# Altium schematic sheet 3.MCU NRF52840.SchDoc: Thingy:91 nRF52840 MCU
size A3; Organization: Nordic Semiconductor; DocumentNumber: 3; SheetNumber: 3; SheetTotal: 6; CompanyName: Nordic Semiconductor; DocumentSize: A3
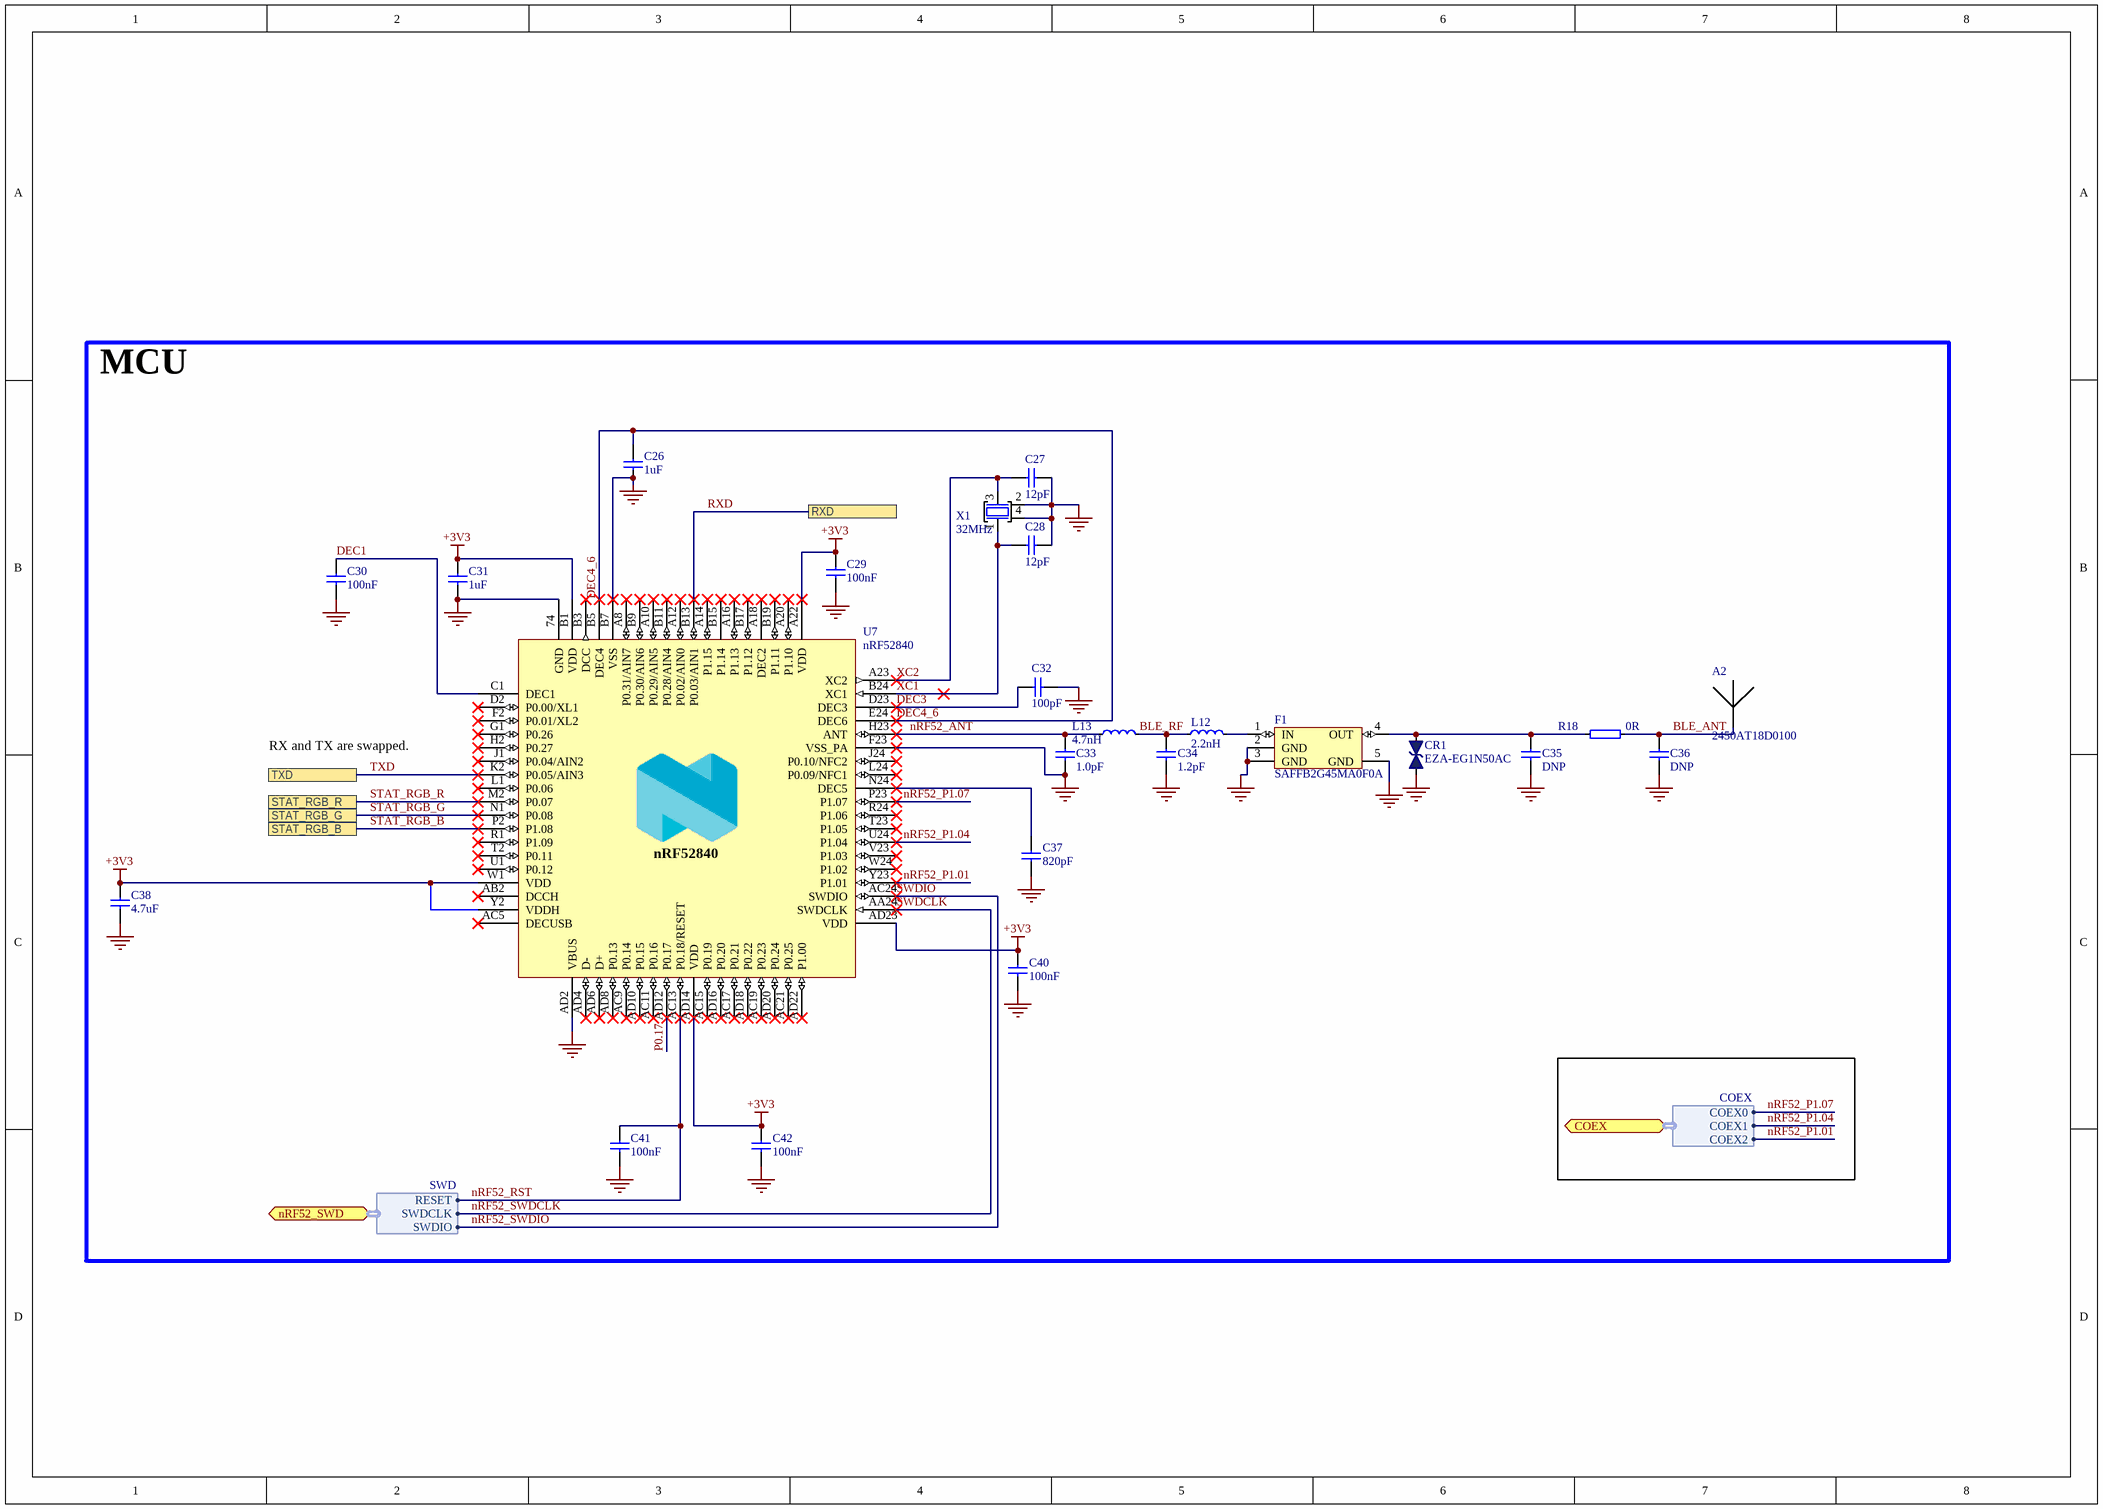
[diagram p0: 3.MCU NRF52840.SchDoc]

## Parts
A2  2450AT18D0100  [2450AT18D0100_STD-R]
C26  1uF  [CAPC1005X04L]
C27  12pF  [CAPC1005X04L]
C28  12pF  [CAPC1005X04L]
C29  100nF  [CAPC1005X04L]
C30  100nF  [CAPC1005X04L]
C31  1uF  [CAPC1005X04L]
C32  100pF  [CAPC1005X04L]
C33  1.0pF  [CAPC0603X03L_C]
C34  1.2pF  [CAPC0603X03L_C]
C35  DNP  [CAPC0603X03L_C]
C36  DNP  [CAPC0603X03L_C]
C37  820pF  [CAPC1005X04L]
C38  4.7uF  [CAPC1005X04L]
C40  100nF  [CAPC1005X04L]
C41  100nF  [CAPC1005X04L]
C42  100nF  [CAPC1005X04L]
CR1  EZA-EG1N50AC  [RESC0603X03L_C]
F1  SAFFB2G45MA0F0A  [SAFFB2G45MA0F0A]
L12  2.2nH  [INDC0603X03L_C]
L13  4.7nH  [INDC0603X03L_C]
R18  0R  [RESC0603X03L_C]
U7  nRF52840  [AQFN50P700X700X85_HS-74N]
X1  32MHz  [BT-XTAL_2016]

## Ports
COEX (bidir, harness COEX), nRF52_SWD (bidir, harness SWD), RXD, STAT_RGB_B, STAT_RGB_G, STAT_RGB_R, TXD

## Harnesses
COEX: COEX2, COEX1, COEX0
SWD: SWDIO, SWDCLK, RESET

## Nets
+3V3: C29.1 C31.1 C38.1 C40.1 C42.1 U7.A22(VDD) U7.AD14(VDD) U7.AD23(VDD) U7.B1(VDD) U7.W1(VDD) U7.Y2(VDDH)
GND: A2.2(GND) C26.2 C27.2 C28.2 C29.2 C30.2 C31.2 C32.2 C33.1 C34.1 C35.1 C36.1 C37.2 C38.2 C40.2 C41.2 C42.2 CR1.1 F1.2(GND) F1.3(GND) F1.5(GND) U7.74(GND) U7.AD2(VBUS) U7.B7(VSS) U7.F23(VSS_PA) X1.2(GND) X1.4(GND)
BLE_ANT: A2.1 C36.2 R18.2
BLE_RF: C34.2 L12.1 L13.2
DEC1: C30.1 U7.C1(DEC1)
DEC3: C32.1 U7.D23(DEC3)
DEC4_6: C26.1 U7.B5(DEC4) U7.E24(DEC6)
nRF52_ANT: C33.2 L13.1 U7.H23(ANT)
nRF52_P1.01: U7.Y23(P1.01) ; port COEX.COEX2
nRF52_P1.04: U7.U24(P1.04) ; port COEX.COEX1
nRF52_P1.07: U7.P23(P1.07) ; port COEX.COEX0
nRF52_RST: C41.1 U7.AC13(P0.18/RESET) ; port nRF52_SWD.RESET
nRF52_SWDCLK: U7.AA24(SWDCLK) ; port nRF52_SWD.SWDCLK  [also labelled SWDCLK]
nRF52_SWDIO: U7.AC24(SWDIO) ; port nRF52_SWD.SWDIO  [also labelled SWDIO]
P0.17: U7.AD12(P0.17)
RXD: U7.B13(P0.03/AIN1) ; port RXD
STAT_RGB_B: U7.P2(P1.08) ; port STAT_RGB_B
STAT_RGB_G: U7.N1(P0.08) ; port STAT_RGB_G
STAT_RGB_R: U7.M2(P0.07) ; port STAT_RGB_R
TXD: U7.K2(P0.05/AIN3) ; port TXD
XC1: C28.1 U7.B24(XC1) X1.1(IN)
XC2: C27.1 U7.A23(XC2) X1.3(OUT)
NetC35_2: C35.2 CR1.2 F1.4(OUT) R18.1
NetC37_1: C37.1 U7.N24(DEC5)
NetF1_1: F1.1(IN) L12.2

Not connected (* = marked no-connect by the designer): U7 A8(P0.31/AIN7)* A10(P0.29/AIN5)* A12(P0.02/AIN0)* A14(P1.15)* A16(P1.13)* A18(DEC2)* A20(P1.10)* AB2(DCCH)* AC5(DECUSB)* AC9(P0.14)* AC11(P0.16)* AC15(P0.19)* AC17(P0.21)* AC19(P0.23)* AC21(P0.25)* AD4(D-)* AD6(D+)* AD8(P0.13)* AD10(P0.15)* AD16(P0.20)* AD18(P0.22)* AD20(P0.24)* AD22(P1.00)* B3(DCC)* B9(P0.30/AIN6)* B11(P0.28/AIN4)* B15(P1.14)* B17(P1.12)* B19(P1.11)* D2(P0.00/XL1)* F2(P0.01/XL2)* G1(P0.26)* H2(P0.27)* J1(P0.04/AIN2)* J24(P0.10/NFC2)* L1(P0.06)* L24(P0.09/NFC1)* R1(P1.09)* R24(P1.06)* T2(P0.11)* T23(P1.05)* U1(P0.12)* V23(P1.03)* W24(P1.02)*

## Notes on the sheet
- MCU
- RX and TX are swapped.
- Size
- Date:
- A3
- Project Number
- Sheet         of
- Revision
- File:
- Drawn By:

## Library data of the parts
A2 = Johanson 2450AT18D0100_STD-R: 2.45 GHz chip antenna; Manufacturer: Johanson Technology; Part number IPS: 00000001415; Note: N.A.; Artikkelnr Noca: 53059035; Pad Count: 4; Part Number: Johanson 2450AT18D0100_STD-R; Manufacturer Part Number: 2450AT18D0100; Footprint Doc: 2450AT18D0100; LatestRevisionDate: 2016-06-02; Published: 2016-01-12; Value: 2450AT18D0100; ComponentLink1URL: N.A.; ComponentLink1Description: Datasheet; ComponentLink2URL: N.A.; ComponentLink2Description: Supplier link; HelpURL: http://www.johansontechnology.com/datasheets/antennas/2450AT18D0100.pdf; Supplier 1: Digi-Key; Digikey Part Number: 712-2450AT18D0100001ECT-ND; Supplier 2: Mouser; Supplier Part Number 2: 609-2450AT18D0100E; Component Class: Antennas; PartId: 100700005; LCSC: Non Stock
C26-C32 C37 C38 C40-C42 = C0402-1µ0: Capacitor, X5R, ±5%, 6.3V; ComponentLink1URL: N.A.; ComponentLink1Description: Datasheet; ComponentLink2URL: N.A.; ComponentLink2Description: Supplier link; Package: 0402
  C26 C31: LCSC: C52923
  C27 C28: LCSC: C482487
  C29 C30 C40-C42: LCSC: C513772
  C32: LCSC: C5120795
  C37: LCSC: C565563
  C38: LCSC: C274416
C33 = C0201-1.0p: Capacitor, NP0, ±0.05pF, 50V; Manufacturer: N.A.; Part number IPS: 00000001247; Pad Count: 2; Part Number: C0201-1.0p; Manufacturer Part Number: N.A.; LatestRevisionDate: 2018-10-22; Published: 2014-11-13; Value: 1.0pF; Footprint Doc: 0201; ComponentLink1URL: N.A.; ComponentLink1Description: Datasheet; ComponentLink2URL: N.A.; ComponentLink2Description: Supplier link; HelpURL: N.A.; Note: 50V; Supplier 1: N.A.; Supplier Part Number 1: N.A.; Supplier 2: N.A.; Supplier Part Number 2: N.A.; Artikkelnr Noca: N.A.; Component Class: Capacitors; PartId: 100200014; LCSC: C88903
C34 = C0201-1.0p: Capacitor, NP0, ±0.05pF, 50V; Manufacturer: N.A.; Part number IPS: 00000001247; Value: 1.0pF; Pad Count: 2; Part Number: C0201-1.0p; Manufacturer Part Number: N.A.; LatestRevisionDate: 2018-10-22; Published: 2014-11-13; Footprint Doc: 0201; ComponentLink1URL: N.A.; ComponentLink1Description: Datasheet; ComponentLink2URL: N.A.; ComponentLink2Description: Supplier link; HelpURL: N.A.; Note: 50V; Supplier 1: N.A.; Supplier Part Number 1: N.A.; Supplier 2: N.A.; Supplier Part Number 2: N.A.; Artikkelnr Noca: N.A.; Component Class: Capacitors; PartId: 100200014; LCSC: C1551
C35 C36 = C0201-0.7p-HQ-Murata: Ceramic Capacitor C0G, NP0 0201, ±0.1pF 25V; ComponentLink1URL: https://search.murata.co.jp/Ceramy/image/img/A01X/G101/ENG/GJM0335C1ER70BB01-01.pdf; ComponentLink1Description: Datasheet; ComponentLink2URL: https://www.murata.com/en-eu/products/productdetail?partno=GJM0335C1ER70BB01%23; ComponentLink2Description: Supplier link; LCSC: NILL
  C35: Package: 0402
  C36: Package: 0201
CR1 = EZA-EG1N50AC: ESD Suppressor, 30V, 0.04pF; Manufacturer: Panasonic; Part number IPS: 00000004437; Note: N.A.; Pad Count: 2; Part Number: EZA-EG1N50AC; Manufacturer Part Number: EZA-EG1N50AC; ComponentLink1URL: https://industrial.panasonic.com/cdbs/www-data/pdf/AWD0000/AWD0000C13.pdf; ComponentLink1Description: Datasheet; ComponentLink2URL: N.A.; ComponentLink2Description: Supplier link; HelpURL: N.A.; Footprint Doc: 0201; LatestRevisionDate: 2020-04-28; Published: 2020-02-06; Value: EZA-EG1N50AC; Artikkelnr Noca: N.A.; Supplier 1: Digi-Key; Digikey Part Number: P122037CT-ND; Supplier 2: N.A.; Supplier Part Number 2: N.A.; Component Class: Semiconductors; PartId: 101300173; LCSC: Not Available
F1 = SAFFB2G45MA0F0A: 2.4 GHz BPF; Manufacturer: Murata; Part number IPS: 00000001784, 80000001660; Artikkelnr Noca: N.A.; Pad Count: 5; Part Number: SAFFB2G45MA0F0A; Manufacturer Part Number: SAFFB2G45MA0F0A; ComponentLink1URL: N.A.; ComponentLink1Description: Datasheet; ComponentLink2URL: N.A.; ComponentLink2Description: Supplier link; HelpURL: N.A.; Footprint Doc: 1109; LatestRevisionDate: 2018-05-15; Published: 2018-05-15; Value: SAFFB2G45MA0F0A; Supplier 1: N.A.; Supplier Part Number 1: N.A.; Supplier 2: N.A.; Supplier Part Number 2: N.A.; Component Class: Filters; PartId: 100800023; Note: N.A.; LCSC: C910680
L12 = L0201-3n9: Inductor, 400mA, ±0.1nH; Manufacturer: Murata; Manufacturer Part Number: LQP03TN3N9B02D; Part number IPS: 00000001253; Value: 3.9nH; Note: N.A.; Pad Count: 2; Part Number: L0201-3n9; LatestRevisionDate: 2017-11-09; Published: 2013-04-10; Footprint Doc: 0201; ComponentLink1URL: N.A.; ComponentLink1Description: Datasheet; ComponentLink2URL: N.A.; ComponentLink2Description: Supplier link; HelpURL: N.A.; Supplier 1: N.A.; Supplier Part Number 1: N.A.; Supplier 2: N.A.; Supplier Part Number 2: N.A.; Artikkelnr Noca: N.A.; Component Class: Inductors; PartId: 100300022; LCSC: C90191
L13 = L0201-4n7: Inductor, 350mA, ±3%; Package: 0201; ComponentLink1Description: Datasheet; ComponentLink2Description: Supplier link; ComponentLink1URL: N.A.; ComponentLink2URL: N.A.; LCSC: C86126
R18 = R0201-2R2: Resistor, ±1%, 0.05W; ComponentLink1URL: N.A.; ComponentLink1Description: Datasheet; ComponentLink2URL: N.A.; ComponentLink2Description: Supplier link; Package: 0201; LCSC: C100147
U7 = nRF52840: AQFN-73-EP(7x7) RF Transceiver ICs ROHS; LCSC: C190794; Package: QFN-73
X1 = XTAL_SMD2016_32MHz_8pF_Murata: XTAL SMD 2016, 32MHz, Cl=8pF, Tol: ±10ppm, Stab: ±10ppm; ComponentLink1Description: Datasheet; ComponentLink1URL: N.A.; ComponentLink2Description: Supplier link; ComponentLink2URL: N.A.; Package: SMD-2016; LCSC: C2965582